# Altium project LiFi_Via_Types.PrjPcb
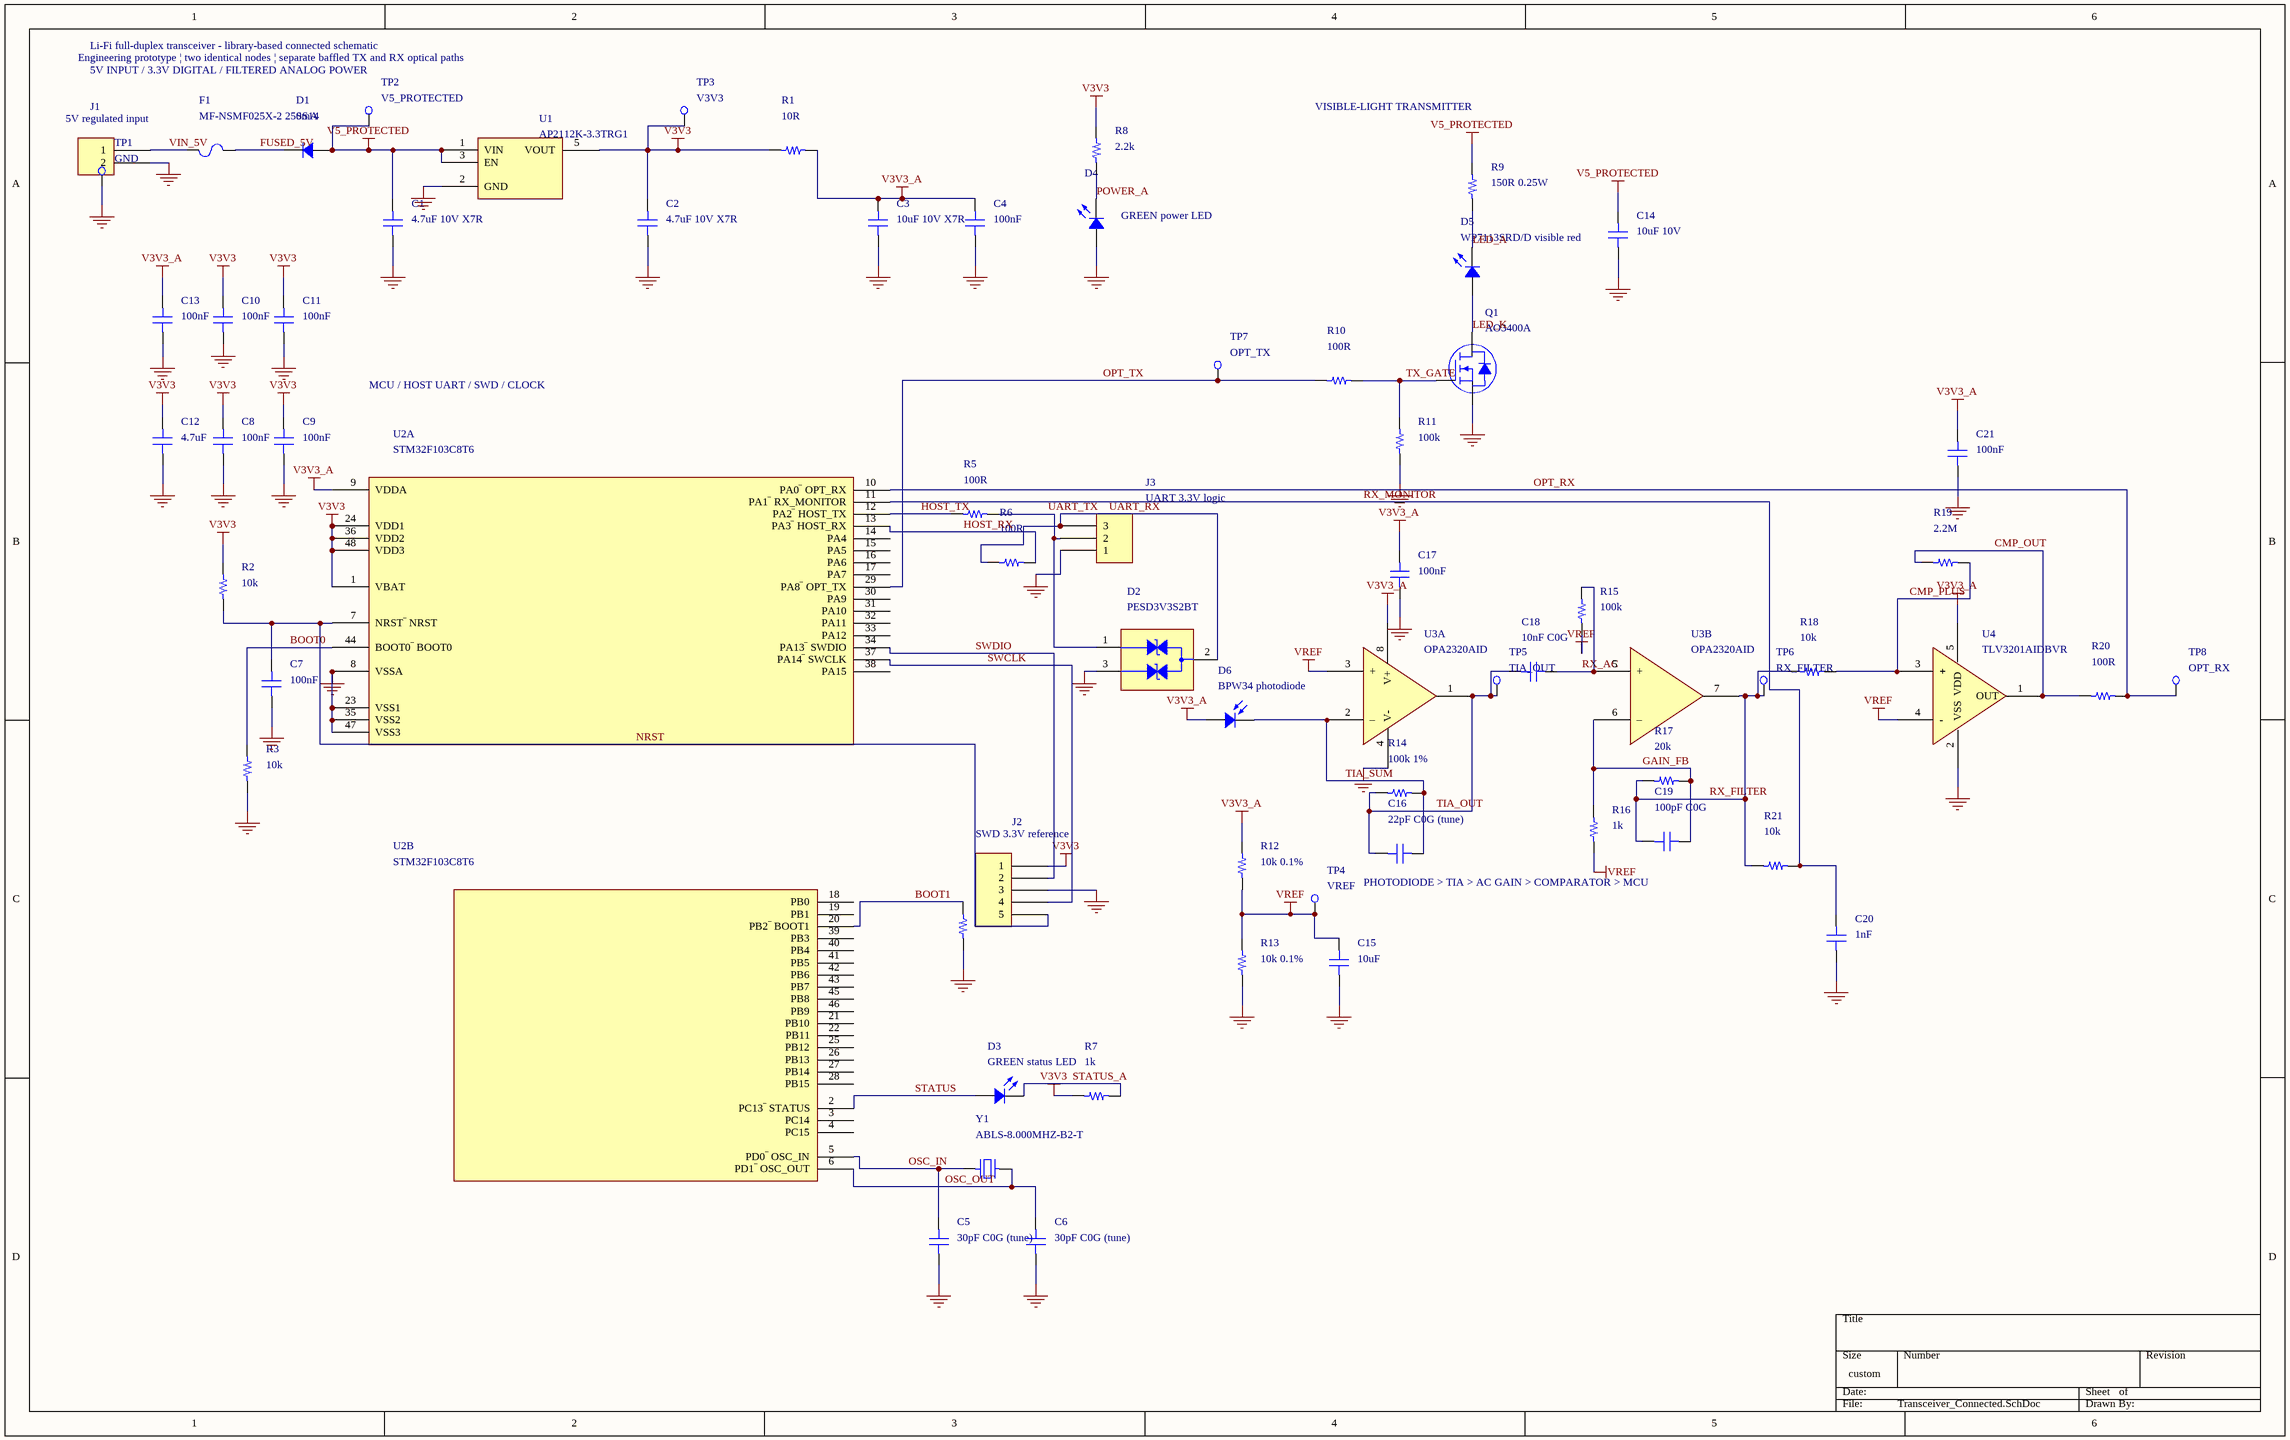
[diagram p0: Transceiver_Connected.SchDoc]
1 sheet, 66 parts. Net scope: global (net labels, ports and power ports of the same name join across sheets).
Board file: LiFi_Connected_no_dr.PcbDoc

## Sheet Transceiver_Connected.SchDoc
size 477 x 299 mm; SheetNumber: 1; SheetTotal: 1

### Parts
C1  4.7uF 10V X7R  [CAP 0805_2012]
C2  4.7uF 10V X7R  [CAP 0805_2012]
C3  10uF 10V X7R  [CAP 0805_2012]
C4  100nF  [CAP 0603_1608]
C5  30pF C0G (tune)  [CAP 0603_1608]
C6  30pF C0G (tune)  [CAP 0603_1608]
C7  100nF  [CAP 0603_1608]
C8  100nF  [CAP 0603_1608]
C9  100nF  [CAP 0603_1608]
C10  100nF  [CAP 0603_1608]
C11  100nF  [CAP 0603_1608]
C12  4.7uF  [CAP 0805_2012]
C13  100nF  [CAP 0603_1608]
C14  10uF 10V  [CAP 0805_2012]
C15  10uF  [CAP 0805_2012]
C16  22pF C0G (tune)  [CAP 0603_1608]
C17  100nF  [CAP 0603_1608]
C18  10nF C0G  [CAP 0603_1608]
C19  100pF C0G  [CAP 0603_1608]
C20  1nF  [CAP 0603_1608]
C21  100nF  [CAP 0603_1608]
D1  SS14  [DO214AC SMA]
D2  PESD3V3S2BT  [NEXPERIA SOT-23-3]
D3  GREEN status LED  [LED 0603_1608 GREEN]
D4  GREEN power LED  [LED 0603_1608 GREEN]
D5  WP7113SRD/D visible red  [KINGBRIGHT WP7113SRD]
D6  BPW34 photodiode  [VISHAY BPW34]
F1  MF-NSMF025X-2 250mA  [BOURNS MF-NSMF025X]
J1  5V regulated input  [SAMTEC SSW-102-03-T-S]
J2  SWD 3.3V reference  [SAMTEC SSW-105-03-T-S]
J3  UART 3.3V logic  [SAMTEC SSW-103-03-T-S]
Q1  AO3400A  [DIODES SOT-23-3]
R1  10R  [RES 0603_1608]
R2  10k  [RES 0603_1608]
R3  10k  [RES 0603_1608]
R4  10k  [RES 0603_1608]
R5  100R  [RES 0603_1608]
R6  100R  [RES 0603_1608]
R7  1k  [RES 0603_1608]
R8  2.2k  [RES 0603_1608]
R9  150R 0.25W  [RES 1206_3216]
R10  100R  [RES 0603_1608]
R11  100k  [RES 0603_1608]
R12  10k 0.1%  [RES 0603_1608]
R13  10k 0.1%  [RES 0603_1608]
R14  100k 1%  [RES 0603_1608]
R15  100k  [RES 0603_1608]
R16  1k  [RES 0603_1608]
R17  20k  [RES 0603_1608]
R18  10k  [RES 0603_1608]
R19  2.2M  [RES 0603_1608]
R20  100R  [RES 0603_1608]
R21  10k  [RES 0603_1608]
TP1  GND  [TEST PAD 1MM]
TP2  V5_PROTECTED  [TEST PAD 1MM]
TP3  V3V3  [TEST PAD 1MM]
TP4  VREF  [TEST PAD 1MM]
TP5  TIA_OUT  [TEST PAD 1MM]
TP6  RX_FILTER  [TEST PAD 1MM]
TP7  OPT_TX  [TEST PAD 1MM]
TP8  OPT_RX  [TEST PAD 1MM]
U1  AP2112K-3.3TRG1  [DIODES SOT-23-5 K]
U2  STM32F103C8T6  [ST LQFP-48 7x7MM]  (parts A,B of 2)
U3  OPA2320AID  [TI SOIC-8 D]  (parts A,B of 2)
U4  TLV3201AIDBVR  [TI SOT-23-5 DBV]
Y1  ABLS-8.000MHZ-B2-T  [ABRACON ABLS]

### Nets
GND: C1.2 C2.2 C3.2 C4.2 C5.2 C6.2 C7.2 C8.2 C9.2 C10.2 C11.2 C12.2 C13.2 C14.2 C15.2 C17.2 C20.2 C21.2 D2.3(CC) D4.1 J1.2 J2.3 J3.1 Q1.2(S) R3.2 R4.2 R11.2 R13.2 TP1.1(TP) U1.2(GND) U2.8(VSSA) U2.23(VSS1) U2.35(VSS2) U2.47(VSS3) U3.4(V-) U4.2(VSS)
V3V3: C2.1 C8.1 C9.1 C10.1 C11.1 C12.1 J2.1 R1.1 R2.1 R7.1 R8.1 TP3.1(TP) U1.5(VOUT) U2.1(VBAT) U2.24(VDD1) U2.36(VDD2) U2.48(VDD3)
V3V3_A: C3.1 C4.1 C13.1 C17.1 C21.1 D6.1 R1.2 R12.1 U2.9(VDDA) U3.8(V+) U4.5(VDD)
V5_PROTECTED: C1.1 C14.1 D1.1 R9.1 TP2.1(TP) U1.1(VIN) U1.3(EN)
VREF: C15.1 R12.2 R13.1 R15.2 R16.2 TP4.1(TP) U3.3(+) U4.4(-)
BOOT0: R3.1 U2.44(BOOT0~{_}_BOOT0)
BOOT1: R4.1 U2.20(PB2~{_}_BOOT1)
CMP_OUT: R19.1 R20.1 U4.1(OUT)
CMP_PLUS: R18.2 R19.2 U4.3(+)
FUSED_5V: D1.2 F1.2
GAIN_FB: C19.2 R16.1 R17.2 U3.6(–)
HOST_RX: R6.2 U2.13(PA3~{_}_HOST_RX)
HOST_TX: R5.1 U2.12(PA2~{_}_HOST_TX)
LED_A: D5.2 R9.2
LED_K: D5.1 Q1.3(D)
NRST: C7.1 J2.5 R2.2 U2.7(NRST~{_}_NRST)
OPT_RX: R20.2 TP8.1(TP) U2.10(PA0~{_}_OPT_RX)
OPT_TX: R10.1 TP7.1(TP) U2.29(PA8~{_}_OPT_TX)
OSC_IN: C5.1 U2.5(PD0~{_}_OSC_IN) Y1.1
OSC_OUT: C6.1 U2.6(PD1~{_}_OSC_OUT) Y1.2
POWER_A: D4.2 R8.2
RX_AC: C18.2 R15.1 U3.5(+)
RX_FILTER: C19.1 R17.1 R18.1 R21.1 TP6.1(TP) U3.7(OUT_B)
RX_MONITOR: C20.1 R21.2 U2.11(PA1~{_}_RX_MONITOR)
STATUS: D3.1 U2.2(PC13~{_}_STATUS)
STATUS_A: D3.2 R7.2
SWCLK: J2.4 U2.37(PA14~{_}_SWCLK)
SWDIO: J2.2 U2.34(PA13~{_}_SWDIO)
TIA_OUT: C16.1 C18.1 R14.1 TP5.1(TP) U3.1(OUT_A)
TIA_SUM: C16.2 D6.2 R14.2 U3.2(–)
TX_GATE: Q1.1(G) R10.2 R11.1
UART_RX: D2.2(K2) J3.3 R6.1
UART_TX: D2.1(K1) J3.2 R5.2
VIN_5V: F1.1 J1.1

Not connected (* = marked no-connect by the designer): U2 3(PC14) 4(PC15) 14(PA4) 15(PA5) 16(PA6) 17(PA7) 18(PB0) 19(PB1) 21(PB10) 22(PB11) 25(PB12) 26(PB13) 27(PB14) 28(PB15) 30(PA9) 31(PA10) 32(PA11) 33(PA12) 38(PA15) 39(PB3) 40(PB4) 41(PB5) 42(PB6) 43(PB7) 45(PB8) 46(PB9)

### Notes on the sheet
- Engineering prototype | two identical nodes | separate baffled TX and RX optical paths
- Li-Fi full-duplex transceiver - library-based connected schematic
- (near TP2) 5V INPUT / 3.3V DIGITAL / FILTERED ANALOG POWER
- VISIBLE-LIGHT TRANSMITTER
- MCU / HOST UART / SWD / CLOCK
- PHOTODIODE > TIA > AC GAIN > COMPARATOR > MCU

### Library data of the parts
C1-C21 = Capacitor: SMT Capacitor; LibrarySource: Celestial Altium Library; see Libraries/Celestial/ATTRIBUTION.md
D1 = Diode: Rectifier Diode; LibrarySource: Celestial Altium Library; see Libraries/Celestial/ATTRIBUTION.md
D2 = ON SEMI SOT-23-3: TVS DIODE; Manufacturer: Nexperia; LibrarySource: Celestial ON SEMI template; pins adapted to Nexperia PESD3V3S2BT datasheet; Manufacturer Part Number: PESD3V3S2BT
D3 D4 = LED: Chip LED; LibrarySource: Celestial Altium Library; see Libraries/Celestial/ATTRIBUTION.md
D5 = LED: Chip LED; Manufacturer: Kingbright; LibrarySource: Celestial Altium Library; see Libraries/Celestial/ATTRIBUTION.md; Manufacturer Part Number: WP7113SRD/D
D6 = PHOTODIODE: Manufacturer: Vishay; LibrarySource: Celestial Altium Library; see Libraries/Celestial/ATTRIBUTION.md; Manufacturer Part Number: BPW34
F1 = MOUNTED FUSE: GENERIC_fuse; Manufacturer: Bourns; LibrarySource: Celestial Altium Library; see Libraries/Celestial/ATTRIBUTION.md; Manufacturer Part Number: MF-NSMF025X-2
J1 = 2 Pin: Manufacturer: Samtec; Manufacturer Part Number: SSW-102-03-T-S; LibrarySource: Celestial Altium Library; see Libraries/Celestial/ATTRIBUTION.md
J2 = 5 Pin: Manufacturer: Samtec; Manufacturer Part Number: SSW-105-03-T-S; LibrarySource: Celestial Altium Library; see Libraries/Celestial/ATTRIBUTION.md
J3 = 3 Pin: Manufacturer: Samtec; Manufacturer Part Number: SSW-103-03-T-S; LibrarySource: Celestial Altium Library; see Libraries/Celestial/ATTRIBUTION.md
Q1 = DIODES INC MOSFET N-CH SOT-23-3: Manufacturer: Alpha & Omega Semiconductor; LibrarySource: Celestial Altium Library; see Libraries/Celestial/ATTRIBUTION.md; Manufacturer Part Number: AO3400A
R1-R21 = Resistor: SMT Resistor; LibrarySource: Celestial Altium Library; see Libraries/Celestial/ATTRIBUTION.md
TP1-TP8 = Test Point: LibrarySource: Celestial Altium Library; see Libraries/Celestial/ATTRIBUTION.md
U1 = DIODES INC AP2112K: Manufacturer: Diodes Incorporated; LibrarySource: Celestial Altium Library; see Libraries/Celestial/ATTRIBUTION.md; Manufacturer Part Number: AP2112K-3.3TRG1
U2 = ST MICROELECTRONICS STM32F103C(8-B)TX LQFP48: LibrarySource: Celestial Altium Library; see Libraries/Celestial/ATTRIBUTION.md; Manufacturer: STMicroelectronics; Manufacturer Part Number: STM32F103C8T6
U3 = TI OPA2320: Manufacturer: Texas Instruments; LibrarySource: Celestial Altium Library; see Libraries/Celestial/ATTRIBUTION.md; Manufacturer Part Number: OPA2320AID
U4 = MICROCHIP MCP6541 5 PIN: Manufacturer: Texas Instruments; LibrarySource: Celestial Altium Library; see Libraries/Celestial/ATTRIBUTION.md; Manufacturer Part Number: TLV3201AIDBVR
Y1 = Abracon Crystal ABLS: SMT Crystal; LibrarySource: Celestial Altium Library; see Libraries/Celestial/ATTRIBUTION.md; Manufacturer: Abracon; Manufacturer Part Number: ABLS-8.000MHZ-B2-T